# EasyEDA Pro project XDS110_高速隔离版.epro

# Schematic Schematic1
Board Name: Board1; Create Date: 2024-12-06; Page Name: P1; Project Name: XDS110_TI; Schematic Name: Schematic1; Update Date: 2025-01-04; BladeWidth: 10; Company: 嘉立创EDA; Page Size: C; RegionStart: 1; ShowBorder: 1; TitleBlock: 1; TitleBlockPosition: 3; Version: V1.0; XRegionCount: 6; YRegionCount: 4
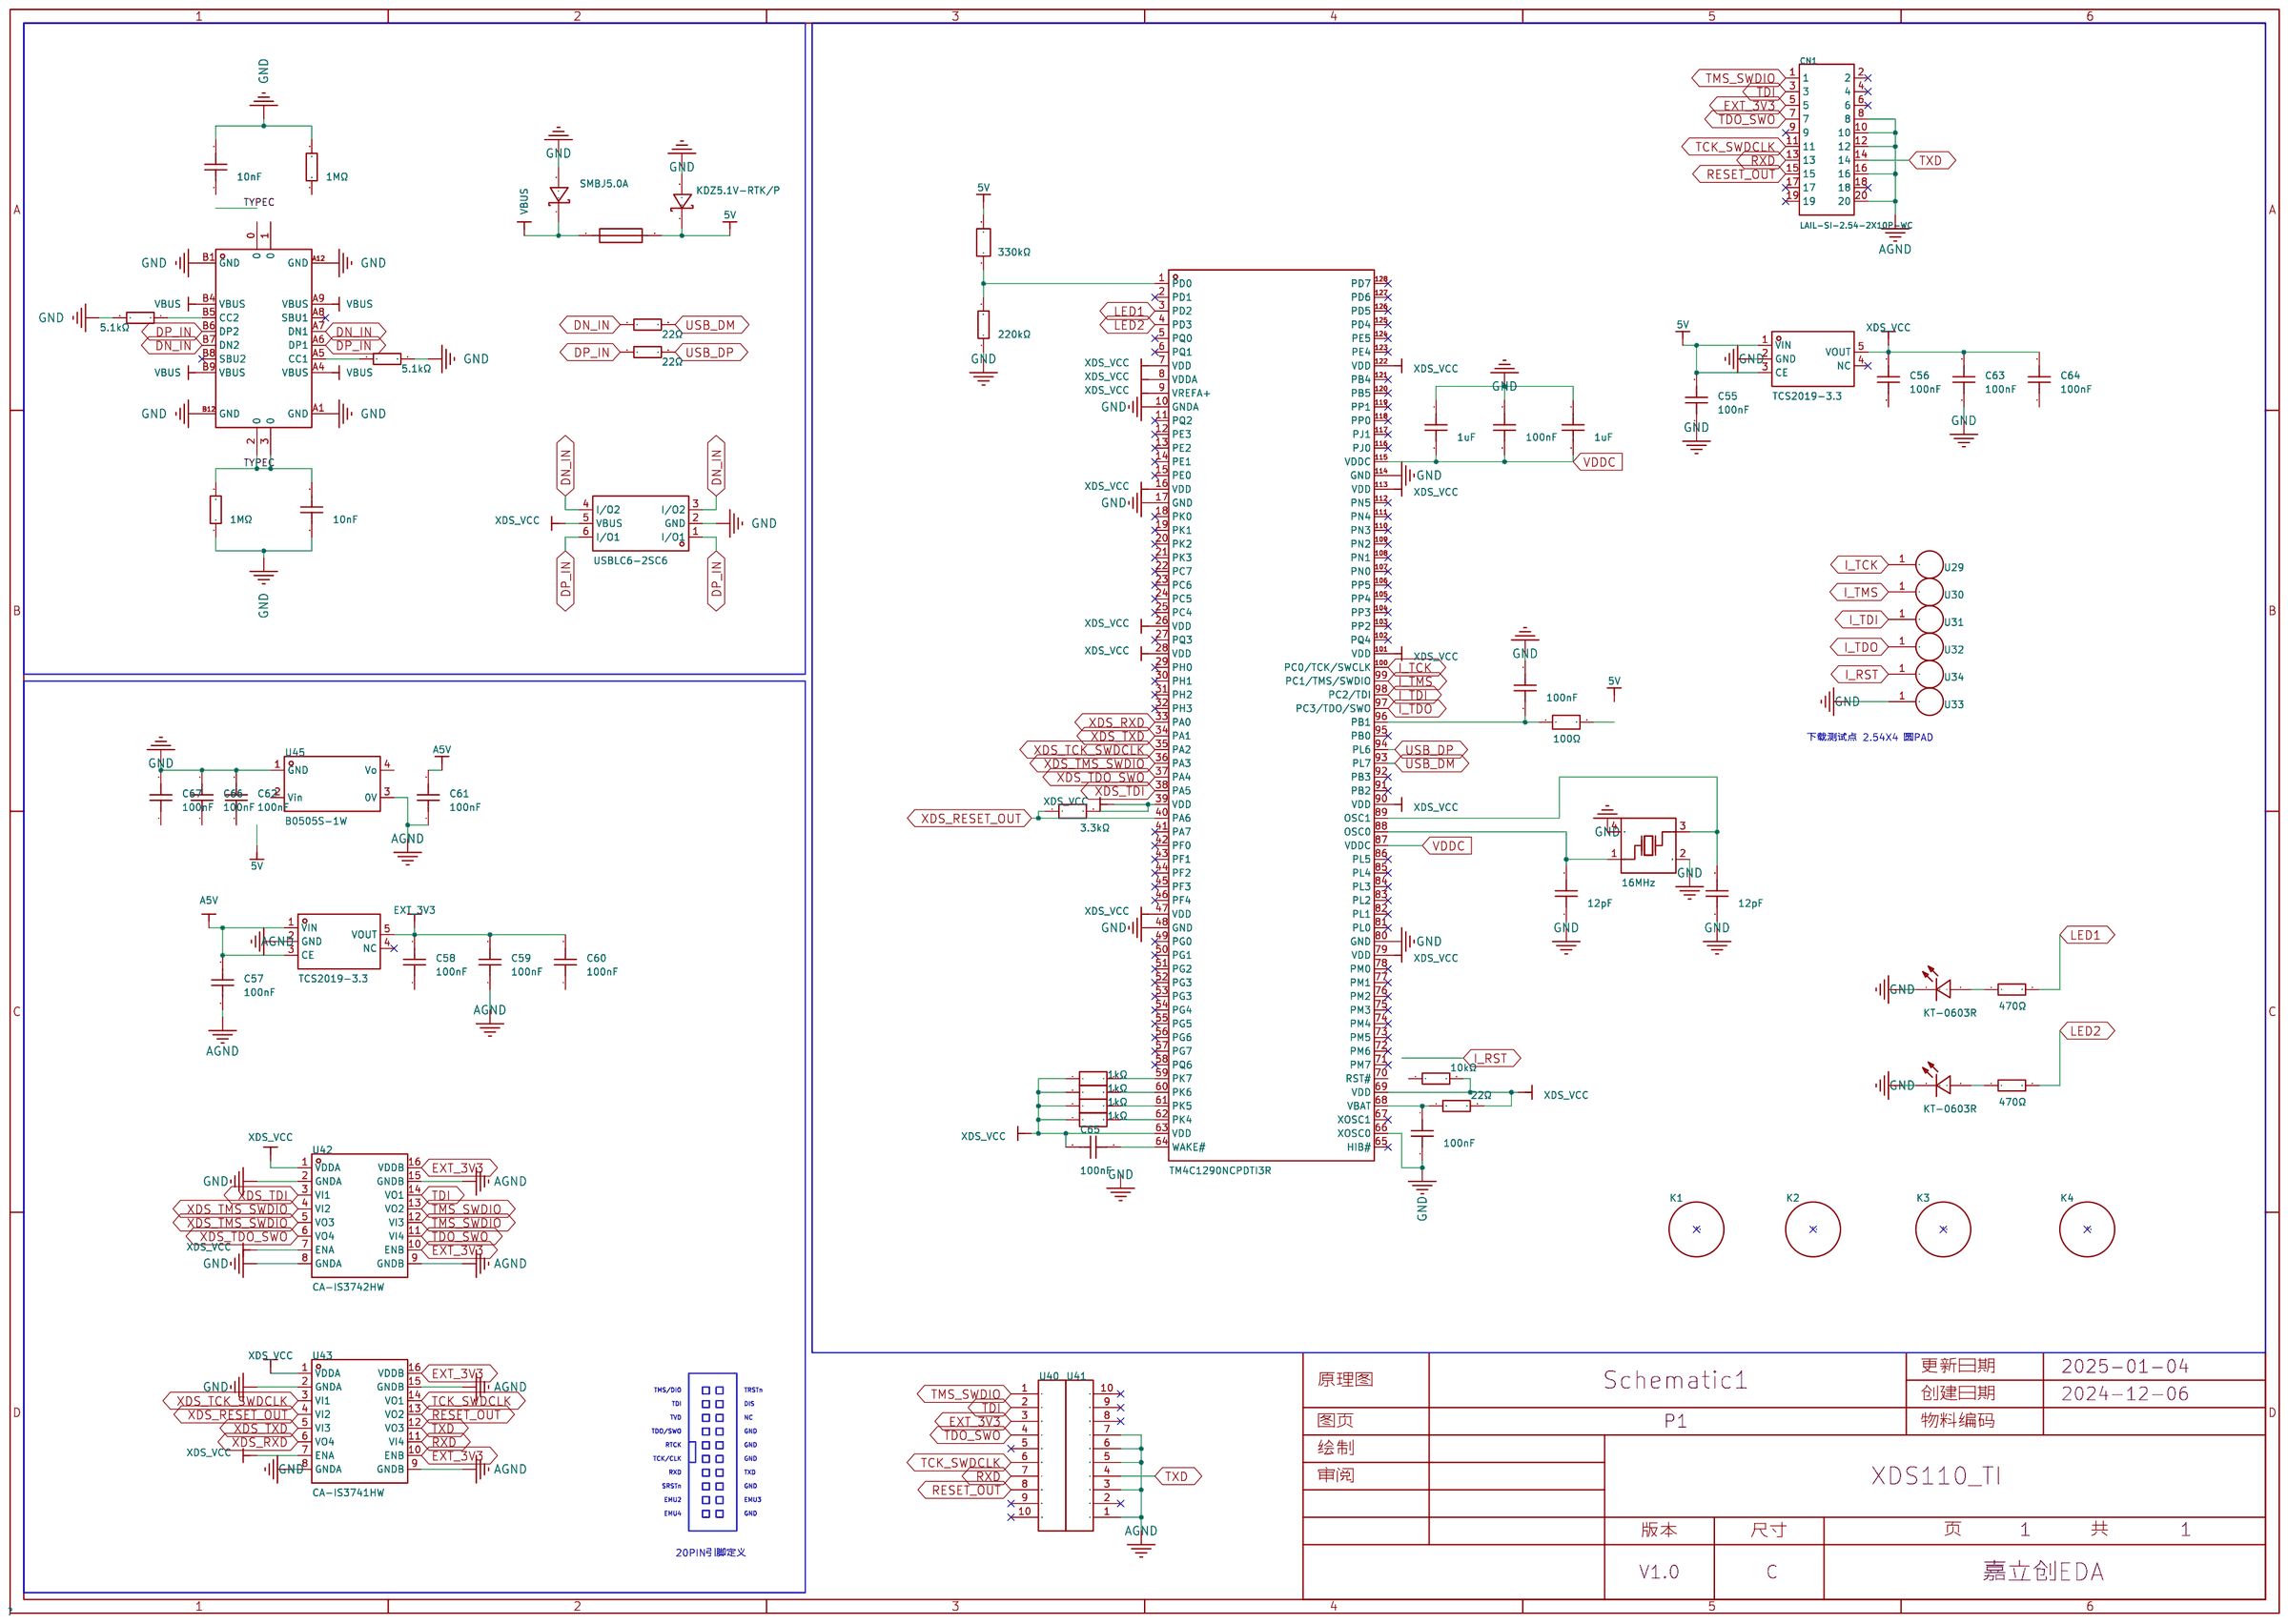
[diagram p0: schematic sheet]

## Parts
C44  10nF  [C0603]
C45  10nF  [C0603]
C46  100nF  [C0603]
C49  1uF  [C0603]
C50  100nF  [C0603]
C51  1uF  [C0603]
C52  100nF  [C0603]
C53  12pF  [C0603]
C54  12pF  [C0603]
C55  100nF  [C0603]
C56  100nF  [C0603]
C57  100nF  [C0603]
C58  100nF  [C0603]
C59  100nF  [C0603]
C60  100nF  [C0603]
C61  100nF  [C0603]
C62  100nF  [C0603]
C63  100nF  [C0603]
C64  100nF  [C0603]
C65  100nF  [C0603]
C66  100nF  [C0603]
C67  100nF  [C0603]
CN1  LAIL-SI-2.54-2X10P-WC  [IDC-TH_20P-P2.54-H-R2-C10-S2.54]  (no BOM)
D1  SMBJ5.0A  [SMB_L4.6-W3.6-LS5.3-RD]
D2  KDZ5.1V-RTK/P  [SOD-323_L1.7-W1.3-LS2.5-RD]
D3  USBLC6-2SC6  [SOT-23-6_L2.9-W1.6-P0.95-LS2.8-BL]
F1  JK-nSMD050-30  [F1206]
J1  -  [USB-C_SMD-TYPE-C-31-M-12]
K1  -  [125 X 300]
K2  -  [125 X 300]
K3  -  [125 X 300]
K4  -  [125 X 300]
LED1  KT-0603R  [LED0603-RD]
LED2  KT-0603R  [LED0603-RD]
R4  470Ω  [R0603]
R33  5.1kΩ  [R0603]
R34  5.1kΩ  [R0603]
R40  22Ω  [R0603]
R41  22Ω  [R0603]
R42  1MΩ  [R0603]
R43  1MΩ  [R0603]
R44  1kΩ  [R0603]
R45  1kΩ  [R0603]
R46  1kΩ  [R0603]
R47  1kΩ  [R0603]
R50  100Ω  [R0603]
R51  330kΩ  [R0603]
R52  220kΩ  [R0603]
R54  470Ω  [R0603]
R55  10kΩ  [R0603]
R63  3.3kΩ  [R0603]
R64  22Ω  [R0603]
U2  TM4C1290NCPDTI3R  [TQFP-128_L14.0-W14.0-P0.40-LS16.0-BL]
U22  TCS2019-3.3  [SOT-23-5_L2.9-W1.6-P0.95-LS2.8-BL]
U24  16MHz  [CRYSTAL-SMD_4P-L3.2-W2.5-BL]
U29  -  [TEST_PAD]
U30  -  [TEST_PAD]
U31  -  [TEST_PAD]
U32  -  [TEST_PAD]
U33  -  [TEST_PAD]
U34  -  [TEST_PAD]
U40  -  [2.54X10P-S]
U41  -  [2.54X10P-S]
U42  CA-IS3742HW  [SOIC-16_L10.3-W7.5-P1.27-LS10.3-BL]
U43  CA-IS3741HW  [SOIC-16_L10.3-W7.5-P1.27-LS10.3-BL]
U44  TCS2019-3.3  [SOT-23-5_L2.9-W1.6-P0.95-LS2.8-BL]
U45  B0505S-1W  [PWRM-TH_BXXXXS-1W]

## Library data of the parts
C44 C45 = CC0603KRX7R9BB103: 容值:10nF;精度:±10%;额定电压:50V;材质(温度系数):X7R;; LCSC Part Name: 10nF ±10% 50V; Supplier Part: C100042; Manufacturer: YAGEO(国巨); Supplier Footprint: 0603; JLCPCB Part Class: Extended Part; Datasheet: https://atta.szlcsc.com/upload/public/pdf/source/20181008/C309510_22F155564471FAF6A489F7D68F34234E.pdf; Supplier: LCSC; Tolerance: ±10%; Voltage Rated: 50V; Temperature Coefficient: X7R
C46 C50 C52 C55-C67 = CGA0603X7R104K500JT: 容值:100nF;精度:±10%;额定电压:50V;材质(温度系数):X7R;; LCSC Part Name: 100nF ±10% 50V; Supplier Part: C6119867; Manufacturer: HRE(芯声); Supplier Footprint: 0603; JLCPCB Part Class: Extended Part; Supplier: LCSC; Tolerance: ±10%; Voltage Rated: 50V; Temperature Coefficient: X7R
C49 C51 = CGA0603X5R105K160JT: 容值:1uF;精度:±10%;额定电压:16V;材质(温度系数):X5R;; LCSC Part Name: 1uF ±10% 16V; Supplier Part: C6119849; Manufacturer: HRE(芯声); Supplier Footprint: 0603; JLCPCB Part Class: Extended Part; Supplier: LCSC; Tolerance: ±10%; Voltage Rated: 16V; Temperature Coefficient: X5R
C53 C54 = CL10C120JB81PNC: 容值:12pF;精度:±5%;额定电压:50V;材质(温度系数):C0G;; LCSC Part Name: 12pF ±5% 50V; Supplier Part: C346206; Manufacturer: SAMSUNG(三星); Supplier Footprint: 0603; Datasheet: https://atta.szlcsc.com/upload/public/pdf/source/20200508/C346214_8E91697E89AACDA228C00DCFD6338EB9.pdf; Supplier: LCSC; Tolerance: ±5%; Voltage Rated: 50V; Temperature Coefficient: C0G
CN1 = LAIL-SI-2.54-2X10P-WC: 连接器类型:简牛座;间距:2.54mm;额定电流:3A;安装方式:弯插;行距:2.54mm;排数:2;每排PIN数:10;触头材质:黄铜;触头镀层:金;工作温度:-40℃~+105℃;; LCSC Part Name: 2.54mm 排数:2 每排P数:10; Supplier Part: C55118384; Manufacturer: 莱联; Supplier Footprint: 弯插,P=2.54mm; JLCPCB Part Class: Extended Part; Datasheet: https://item.szlcsc.com/datasheet/LAIL-SI-2.54-2X10P-WC/58822694.html; Supplier: LCSC; Connector Type: 简牛座; Pitch: 2.54mm; Current Rating: 3A; Holder Type: 弯插; Row Spacing: 2.54mm; Number of Rows: 2; Number of PINs Per Row: 10; Contact Material: 黄铜; Contact Plating: 金; Operating Temperature: -40℃~+105℃; Color: 黑色
D1 = SMBJ5.0A: 反向截止电压(Vrwm):5V;最大钳位电压:9.2V;峰值脉冲电流(Ipp)@10/1000us:65.22A;击穿电压:6.4V;; Supplier Part: C357965; Manufacturer: DOWO(东沃); Supplier Footprint: SMB(DO-214AA); Datasheet: https://atta.szlcsc.com/upload/public/pdf/source/20190724/C406700_6369D0A46FA5E14EA5A4BABB7177C57B.pdf; Supplier: LCSC; Reverse Stand-Off Voltage (Vrwm): 5V; Maximum Clamping Voltage: 9.2V; Peak Pulse Current (Ipp)@10/1000us: 65.22A; Breakdown Voltage: 6.4V; Type: TVS
D2 = KDZ5.1V-RTK/P: 二极管配置:独立式;稳压值(标称值):-;稳压值(范围):4.8V~5.4V;功率(Pd):200mW;; LCSC Part Name: KDZ5.1V-RTK/P 停产; Supplier Part: C155471; Manufacturer: KEC; Supplier Footprint: USC(SOD-323); JLCPCB Part Class: 扩展库; Datasheet: https://atta.szlcsc.com/upload/public/pdf/source/20171201/C155472_15121212927631157469.pdf; Supplier: LCSC; Diode Configuration: 独立式; Reverse Leakage Current (Ir): 1uA@1.5V; Zener Voltage (Range): 4.8V~5.4V; Power Dissipation: 200mW; Zener Impedance (Zzt): 70Ω
D3 = USBLC6-2SC6: 最大钳位电压:15V;击穿电压:6V;; Supplier Part: C2687116; Manufacturer: UMW(友台半导体); Supplier Footprint: SOT-23-6; Datasheet: https://atta.szlcsc.com/upload/public/pdf/source/20231109/512642D850D9873E7C519F71E85B9A10.pdf; Supplier: LCSC; Maximum Clamping Voltage: 15V; Breakdown Voltage: 6V; Number of Lines: 双路; Type: ESD
F1 = JK-nSMD050-30: 最大电压:30V;最大电流:100A;保持电流:500mA;跳闸电流:1A;消耗功率:600mW;初始态阻值(最小值):150mΩ;跳断后阻值(最大值):300mΩ;最大动作时间:100ms;工作温度:-40℃~+85℃;; LCSC Part Name: 0.5A 30V 1206 自恢复保险丝 PTC; Supplier Part: C720075; Manufacturer: JK(金科); Supplier Footprint: 1206; JLCPCB Part Class: Extended Part; Datasheet: https://atta.szlcsc.com/upload/public/pdf/source/20200810/C720075_06AF2D4541537091880CC35F0EFB49F8.pdf; Supplier: LCSC; Operating Voltage (Max): 30V; Current Rating (Max): 100A; Hold Current: 500mA; Trip Current: 1A; Power Dissipation: 600mW; Resistance - Initial (Ri) (Min): 150mΩ; Resistance - Post Trip (R1) (Max): 300mΩ; Maximum Time to Trip: 100ms; Operating Temperature: -40℃~+85℃
J1 = TYPE-C-31-M-12: 连接器类型:Type-C;标准:-;公母:母座;触点数量:16;端口数量:1;额定电流 - 电源:250mA;; Supplier Part: C165948; Manufacturer: 韩国韩荣; JLCPCB Part Class: Extended Part; Datasheet: https://atta.szlcsc.com/upload/public/pdf/source/20210111/C2682493_D8CCFED08835E878D16ACCF4460E43B8.pdf; Supplier: LCSC; Connector Type: Type-C; Gender: 母座; Number of Contacts: 16; Number of Ports: 1; Current Rating - Power (Max): 250mA
K1-K4 = 125 X 300: Standardization Check: false
LED1 LED2 = KT-0603R: 发光颜色:红色;功率:-;正向电流:-;主波长:-;二极管配置:-;透镜颜色:-;色温:-;发光角度:-;载带方式:-;工作温度:-40℃~+85℃;; LCSC Part Name: 0603 红灯 高亮; Supplier Part: C2286; Manufacturer: KENTO; Supplier Footprint: 0603; JLCPCB Part Class: 基础库; Datasheet: https://atta.szlcsc.com/upload/public/pdf/source/20160616/1466072038404.pdf; Supplier: LCSC; Emitted Color: 红色; Operating Temperature: -40℃~+85℃
R4 R54 = 0603WAF4700T5E: 电阻类型:厚膜电阻;阻值:470Ω;精度:±1%;功率:100mW;最大工作电压:75V;温度系数:±100ppm/℃;; LCSC Part Name: 470Ω ±1% 100mW 厚膜电阻; Supplier Part: C23179; Manufacturer: UNI-ROYAL(厚声); Supplier Footprint: 0603; JLCPCB Part Class: Basic Part; Datasheet: https://atta.szlcsc.com/upload/public/pdf/source/20200306/C422600_1E6D84923E4A46A82E41ADD87F860B5C.pdf; Supplier: LCSC; Type: 厚膜电阻; Tolerance: ±1%; Power(Watts): 100mW; Overload Voltage (Max): 75V; Temperature Coefficient: ±100ppm/℃; Operating Temperature Range: -55℃~+155℃
R33 R34 = 0603WAF5101T5E: 电阻类型:厚膜电阻;阻值:5.1kΩ;精度:±1%;功率:100mW;最大工作电压:75V;温度系数:±100ppm/℃;; LCSC Part Name: 5.1kΩ ±1% 100mW 厚膜电阻; Supplier Part: C23186; Manufacturer: UNI-ROYAL(厚声); Supplier Footprint: 0603; JLCPCB Part Class: Basic Part; Datasheet: https://atta.szlcsc.com/upload/public/pdf/source/20200306/C422600_1E6D84923E4A46A82E41ADD87F860B5C.pdf; Supplier: LCSC; Type: 厚膜电阻; Tolerance: ±1%; Power(Watts): 100mW; Overload Voltage (Max): 75V; Temperature Coefficient: ±100ppm/℃; Operating Temperature Range: -55℃~+155℃
R40 R41 R64 = 0603WAF220JT5E: 电阻类型:厚膜电阻;阻值:22Ω;精度:±1%;功率:100mW;最大工作电压:75V;温度系数:±100ppm/℃;; LCSC Part Name: 22Ω ±1% 100mW 厚膜电阻; Supplier Part: C23345; Manufacturer: UNI-ROYAL(厚声); Supplier Footprint: 0603; JLCPCB Part Class: Basic Part; Datasheet: https://atta.szlcsc.com/upload/public/pdf/source/20200306/C422600_1E6D84923E4A46A82E41ADD87F860B5C.pdf; Supplier: LCSC; Type: 厚膜电阻; Tolerance: ±1%; Power(Watts): 100mW; Overload Voltage (Max): 75V; Temperature Coefficient: ±100ppm/℃; Operating Temperature Range: -55℃~+155℃
R42 R43 = 0603WAF1004T5E: 电阻类型:厚膜电阻;阻值:1MΩ;精度:±1%;功率:100mW;最大工作电压:75V;温度系数:±100ppm/℃;; LCSC Part Name: 1MΩ ±1% 100mW 厚膜电阻; Supplier Part: C22935; Manufacturer: UNI-ROYAL(厚声); Supplier Footprint: 0603; Datasheet: https://atta.szlcsc.com/upload/public/pdf/source/20200306/C422600_1E6D84923E4A46A82E41ADD87F860B5C.pdf; Supplier: LCSC; Type: 厚膜电阻; Tolerance: ±1%; Power(Watts): 100mW; Overload Voltage (Max): 75V; Temperature Coefficient: ±100ppm/℃; Operating Temperature Range: -55℃~+155℃
R44-R47 = AS03W4J0102T5E: 电阻类型:厚膜电阻;阻值:1kΩ;精度:±5%;功率:250mW;最大工作电压:75V;温度系数:±100ppm/℃;; LCSC Part Name: 1kΩ ±5% 250mW 厚膜电阻; Supplier Part: C966204; Manufacturer: UNI-ROYAL(厚声); Supplier Footprint: 0603; Datasheet: https://atta.szlcsc.com/upload/public/pdf/source/20200723/C560412_34ABBCC623B52ADD707B94178459E29E.pdf; Supplier: LCSC; Type: 厚膜电阻; Tolerance: ±5%; Power(Watts): 250mW; Overload Voltage (Max): 75V; Temperature Coefficient: ±100ppm/℃; Operating Temperature Range: -55℃~+155℃
R50 = AR03BTD1000: 阻值:100Ω;精度:±0.1%;功率:62.5mW;温度系数:±50ppm/℃;; LCSC Part Name: 100Ω ±0.1% 62.5mW; Supplier Part: C881893; Manufacturer: Viking(光颉); Supplier Footprint: 0603; Datasheet: https://atta.szlcsc.com/upload/public/pdf/source/20191129/C465721_10D49275DB41E427863CE9C8D788770A.pdf; Supplier: LCSC; Tolerance: ±0.1%; Power(Watts): 62.5mW; Temperature Coefficient: ±50ppm/℃
R51 = CR0603J330KP05Z: 电阻类型:厚膜电阻;阻值:330kΩ;精度:±5%;功率:100mW;温度系数:±100ppm/℃;; LCSC Part Name: 厚膜电阻 330kΩ ±5% 100mW; Supplier Part: C881174; Manufacturer: EVER OHMS(天二科技); Supplier Footprint: 0603; Datasheet: https://atta.szlcsc.com/upload/public/pdf/source/20201014/C881429_ABC29D63C8D6A11EB63D87348B25AA7B.pdf; Supplier: LCSC; Type: 厚膜电阻; Tolerance: ±5%; Power(Watts): 100mW; Temperature Coefficient: ±100ppm/℃; Operating Temperature Range: -55℃~+155℃
R52 = PTFR0603B220KP9: 电阻类型:薄膜电阻;阻值:220kΩ;精度:±0.1%;功率:100mW;最大工作电压:100V;温度系数:±25ppm/℃;; LCSC Part Name: 薄膜电阻 220kΩ ±0.1% 100mW; Supplier Part: C351667; Manufacturer: RESI(开步睿思); Supplier Footprint: 0603; Datasheet: https://atta.szlcsc.com/upload/public/pdf/source/20240506/11BDC7478D84177AC2A5326A65B6EB29.pdf; Supplier: LCSC; Type: 薄膜电阻; Tolerance: ±0.1%; Power(Watts): 100mW; Overload Voltage (Max): 100V; Temperature Coefficient: ±25ppm/℃; Operating Temperature Range: -55℃~+125℃
R55 = HV73V1JTTD1002F: 电阻类型:厚膜电阻;阻值:10kΩ;精度:±1%;功率:100mW;温度系数:±100ppm/℃;; LCSC Part Name: 厚膜电阻 10kΩ ±1% 100mW; Supplier Part: C3930526; Manufacturer: KOA; Supplier Footprint: 0603; JLCPCB Part Class: 扩展库; Supplier: LCSC; Type: 厚膜电阻; Tolerance: ±1%; Power(Watts): 100mW; Temperature Coefficient: ±100ppm/℃; Operating Temperature Range: -55℃~+155℃
R63 = MCR03EZPFX3301: 电阻类型:厚膜电阻;阻值:3.3kΩ;精度:±1%;功率:100mW;最大工作电压:50V;温度系数:±100ppm/℃;; LCSC Part Name: 厚膜电阻 3.3kΩ ±1% 100mW; Supplier Part: C161994; Manufacturer: ROHM(罗姆); Supplier Footprint: 0603; Datasheet: https://atta.szlcsc.com/upload/public/pdf/source/20190315/C161994_799CAE167ED844E94A2FAF0782E59E4D.pdf; Supplier: LCSC; Type: 厚膜电阻; Tolerance: ±1%; Power(Watts): 100mW; Overload Voltage (Max): 50V; Temperature Coefficient: ±100ppm/℃; Operating Temperature Range: -55℃~+155℃
U2 = TM4C1290NCPDTI3R: CPU内核:-;程序存储容量:1MB;GPIO端口数量:90;工作电压范围:2.97V~3.63V;CPU最大主频:120MHz;; LCSC Part Name: 具有 120MHZ 频率、1MB 闪存、256KB RAM、USB、基于 Arm Cortex-M4F 的 32 位 MCU; Supplier Part: C470967; Manufacturer: TI(德州仪器); Supplier Footprint: TQFP-128(14x14); JLCPCB Part Class: 扩展库; Datasheet: https://www.ti.com/cn/lit/gpn/tm4c1290ncpdt; Supplier: LCSC; Program Storage Size: 1MB; GPIO Ports Number: 90; Operating Voltage Range: 2.97V~3.63V; CPU Maximum Speed: 120MHz; Operating Temperature Range: -40℃~+85℃; ADC (Bit): 12bit; Universal Serial Bus: 有; Watchdog: 有; Infrared Data Association: 有; Low-Voltage Detect: 有; Direct Memory Access: 有; Internal Oscillator: 有
U22 U44 = TCS2019-3.3: Supplier Part: C9900011639; Supplier Footprint: SOT-23-5; JLCPCB Part Class: 扩展库; Supplier: LCSC
U24 = ECS-160-9-33B-CWN-TR: 频率:16MHz;常温频差:±10ppm;外接负载电容:9pF;频率稳定度(全温):±15ppm;; LCSC Part Name: 16MHz ±10ppm 9pF; Supplier Part: C2599119; Manufacturer: ECS; Supplier Footprint: SMD3225-4P; JLCPCB Part Class: 扩展库; Datasheet: https://atta.szlcsc.com/upload/public/pdf/source/20221101/385B7103C37C13CA6DFA158A3381826D.pdf; Supplier: LCSC; Normal temperature Frequency Tolerance: ±10ppm; External load capacitor: 9pF; Frequency Stability(Full temperature range): ±15ppm; Equivalent Series Resistance (ESR): 60Ω; Operating Temperature: -40℃~+85℃
U29-U34 = TEST_PAD: 测试点PAD; Standardization Check: false
U40 U41 = 2.54X10P-S: Standardization Check: false
U42 = CA-IS3742HW: 4通道数字隔离器,电容隔离; LCSC Part Name: CA-IS374x 高速四通道数字隔离器; Supplier Part: C528654; Manufacturer: Chipanalog(川土微); Supplier Footprint: SOIC-16-300mil; Datasheet: https://atta.szlcsc.com/upload/public/pdf/source/20240402/A6B3DE0FE33F5A1BA9DC823DA65C6095.pdf; Supplier: LCSC; Number of Forward Channels: 2; Number of Reverse Channels: 2; Data Rate(Max): 150Mbps; Isolation Voltage(Vrms): 5000; CMTI(kV/us): 150kV/us; Integrated Power Supply: 否; Operating Temperature: -40℃~125℃; Rating: 工业级
U43 = CA-IS3741HW: 4通道数字隔离器,电容隔离; LCSC Part Name: CA-IS374x 高速四通道数字隔离器; Supplier Part: C428890; Manufacturer: Chipanalog(川土微); Supplier Footprint: SOIC-16-300mil; JLCPCB Part Class: 扩展库; Datasheet: https://atta.szlcsc.com/upload/public/pdf/source/20240402/A6B3DE0FE33F5A1BA9DC823DA65C6095.pdf; Supplier: LCSC; Number of Forward Channels: 3; Number of Reverse Channels: 1; Data Rate(Max): 150Mbps; Isolation Voltage(Vrms): 5000; CMTI(kV/us): 150kV/us; Integrated Power Supply: 否; Operating Temperature: -40℃~125℃; Rating: 工业级
U45 = B0505S-1W: DC-DC 模块电源; Supplier Part: C16787; Manufacturer: MORNSUN(金升阳); Supplier Footprint: SIP-4; Datasheet: https://atta.szlcsc.com/upload/public/pdf/source/20131028/1457706658921.pdf; Supplier: LCSC

## Nets
5V: C55.2 C62.1 C66.1 C67.1 D2.1(C) F1.2 R50.2 R51.2 U22.1(VIN) U22.3(CE) U45.2(Vin)
A5V: C57.2 C61.2 U44.1(VIN) U44.3(CE) U45.4(Vo)
AGND: C57.1 C58.1 C59.1 C60.1 C61.1 CN1.8 CN1.10 CN1.12 CN1.16 CN1.20 U41.1 U41.3 U41.5 U41.6 U41.7 U42.9(GNDB) U42.15(GNDB) U43.9(GNDB) U43.15(GNDB) U44.2(GND) U45.3(0V)
GND: C44.1 C45.2 C46.1 C49.1 C50.1 C51.1 C52.2 C53.1 C54.1 C55.1 C56.1 C62.2 C63.1 C64.1 C65.1 C66.2 C67.2 D1.2(A) D2.2(A) D3.2(GND) J1.A1(GND) J1.A12(GND) J1.B1(GND) J1.B12(GND) LED1.1(K) LED2.1(K) R33.2 R34.2 R42.1 R43.2 R52.1 U2.10(GNDA) U2.17(GND) U2.48(GND) U2.64(WAKE#) U2.66(XOSC0) U2.80(GND) U2.114(GND) U22.2(GND) U24.2(Gnd) U24.4(Gnd) U33.1 U42.2(GNDA) U42.8(GNDA) U43.2(GNDA) U43.8(GNDA) U45.1(GND)
VBUS: D1.1(K) F1.1 J1.A4(VBUS) J1.A9(VBUS) J1.B4(VBUS) J1.B9(VBUS)
VDDC: C49.2 C50.2 C51.2 U2.87(VDDC) U2.115(VDDC)
DN_IN: D3.3(I/O2) D3.4(I/O2) J1.A7(DN1) J1.B7(DN2) R40.1
DP_IN: D3.1(I/O1) D3.6(I/O1) J1.A6(DP1) J1.B6(DP2) R41.1
EXT_3V3: C58.2 C59.2 C60.2 CN1.5 U40.3 U42.10(ENB) U42.16(VDDB) U43.10(ENB) U43.16(VDDB) U44.5(VOUT)
I_RST: R55.1 U2.70(RST#) U34.1
I_TCK: U2.100(PC0/TCK/SWCLK) U29.1
I_TDI: U2.98(PC2/TDI) U31.1
I_TDO: U2.97(PC3/TDO/SWO) U32.1
I_TMS: U2.99(PC1/TMS/SWDIO) U30.1
LED1: R4.2 U2.3(PD2)
LED2: R54.2 U2.4(PD3)
RESET_OUT: CN1.15 U40.8 U43.13(VO2)
RXD: CN1.13 U40.7 U43.11(VI4)
TCK_SWDCLK: CN1.11 U40.6 U43.14(VO1)
TDI: CN1.3 U40.2 U42.14(VO1)
TDO_SWO: CN1.7 U40.4 U42.11(VI4)
TMS_SWDIO: CN1.1 U40.1 U42.12(VI3) U42.13(VO2)
TXD: CN1.14 U41.4 U43.12(VO3)
TYPEC: C44.2 C45.1 J1.0 J1.1(0) J1.2(0) J1.3(0) R42.2 R43.1
USB_DM: R40.2 U2.93(PL7)
USB_DP: R41.2 U2.94(PL6)
XDS_RESET_OUT: R63.1 U2.40(PA6) U43.4(VI2)
XDS_RXD: U2.33(PA0) U43.6(VO4)
XDS_TCK_SWDCLK: U2.35(PA2) U43.3(VI1)
XDS_TDI: U2.38(PA5) U42.3(VI1)
XDS_TDO_SWO: U2.37(PA4) U42.6(VO4)
XDS_TMS_SWDIO: U2.36(PA3) U42.4(VI2) U42.5(VO3)
XDS_TXD: U2.34(PA1) U43.5(VI3)
XDS_VCC: C56.2 C63.2 C64.2 C65.2 D3.5(VBUS) R44.1 R45.1 R46.1 R47.1 R55.2 R63.2 R64.2 U2.7(VDD) U2.8(VDDA) U2.9(VREFA+) U2.16(VDD) U2.26(VDD) U2.28(VDD) U2.39(VDD) U2.47(VDD) U2.63(VDD) U2.69(VDD) U2.79(VDD) U2.90(VDD) U2.101(VDD) U2.113(VDD) U2.122(VDD) U22.5(VOUT) U42.1(VDDA) U42.7(ENA) U43.1(VDDA) U43.7(ENA)
$1N2204: J1.A5(CC1) R34.1
$1N2206: J1.B5(CC2) R33.1
$1N6737: R44.2 U2.62(PK4)
$1N6739: R45.2 U2.61(PK5)
$1N6741: R47.2 U2.59(PK7)
$1N6743: R46.2 U2.60(PK6)
$1N7379: R51.1 R52.2 U2.1(PD0)
$1N7618: LED1.2(A) R4.1
$1N7777: LED2.2(A) R54.1
$1N11125: C46.2 R50.1 U2.96(PB1)
$1N11220: C52.1 R64.1 U2.68(VBAT)
$1N11476: C53.2 U2.88(OSC0) U24.1(In/Out)
$1N11478: C54.2 U2.89(OSC1) U24.3(In/Out)

Not connected (* = marked no-connect by the designer): CN1 2* 4* 6* 9* 17* 18* 19*; J1 A8(SBU1)* B8(SBU2)*; K1 1*; K2 1*; K3 1*; K4 1*; U2 2(PD1)* 5(PQ0)* 6(PQ1)* 11(PQ2)* 12(PE3)* 13(PE2)* 14(PE1)* 15(PE0)* 18(PK0)* 19(PK1)* 20(PK2)* 21(PK3)* 22(PC7)* 23(PC6)* 24(PC5)* 25(PC4)* 27(PQ3)* 29(PH0)* 30(PH1)* 31(PH2)* 32(PH3)* 41(PA7)* 42(PF0)* 43(PF1)* 44(PF2)* 45(PF3)* 46(PF4)* 49(PG0)* 50(PG1)* 51(PG2)* 52(PG3)* 53(PG3)* 54(PG4)* 55(PG5)* 56(PG6)* 57(PG7)* 58(PQ6)* 65(HIB#)* 67(XOSC1)* 71(PM7)* 72(PM6)* 73(PM5)* 74(PM4)* 75(PM3)* 76(PM2)* 77(PM1)* 78(PM0)* 81(PL0)* 82(PL1)* 83(PL2)* 84(PL3)* 85(PL4)* 86(PL5)* 91(PB2)* 92(PB3)* 95(PB0)* 102(PQ4)* 103(PP2)* 104(PP3)* 105(PP4)* 106(PP5)* 107(PN0)* 108(PN1)* 109(PN2)* 110(PN3)* 111(PN4)* 112(PN5)* 116(PJ0)* 117(PJ1)* 118(PP0)* 119(PP1)* 120(PB5)* 121(PB4)* 123(PE4)* 124(PE5)* 125(PD4)* 126(PD5)* 127(PD6)* 128(PD7)*; U22 4(NC)*; U40 5* 9* 10*; U41 2* 8* 9* 10*; U44 4(NC)*

## Notes on the sheet
- 下载测试点 2.54X4 圆PAD
- TDI
- TMS/DIO
- DIS
- TRSTn
- TVD
- NC
- TDO/SWO
- GND
- RTCK
- GND
- TCK/CLK
- GND
- RXD
- SRSTn
- GND
- TXD
- EMU2
- EMU3
- EMU4
- GND
- 20PIN引脚定义

# Board PCB1
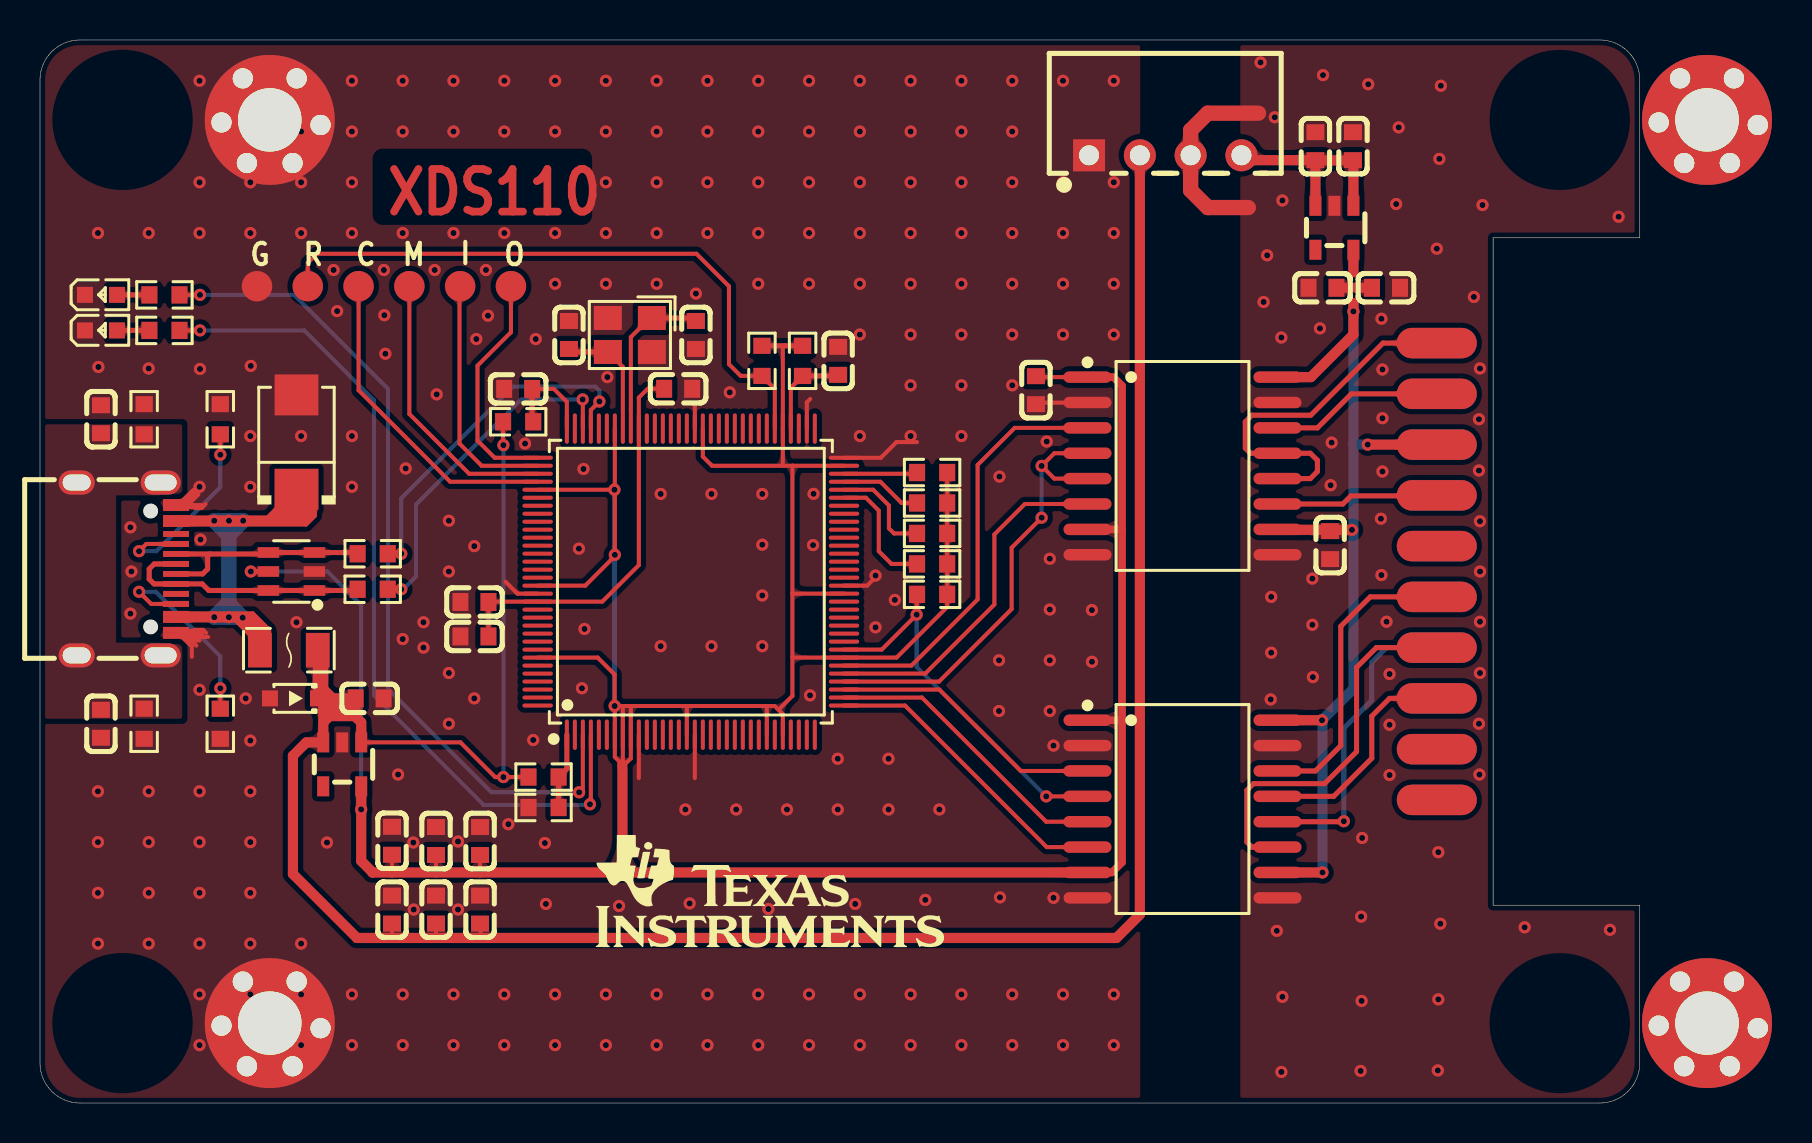
[diagram p1: board, top side]
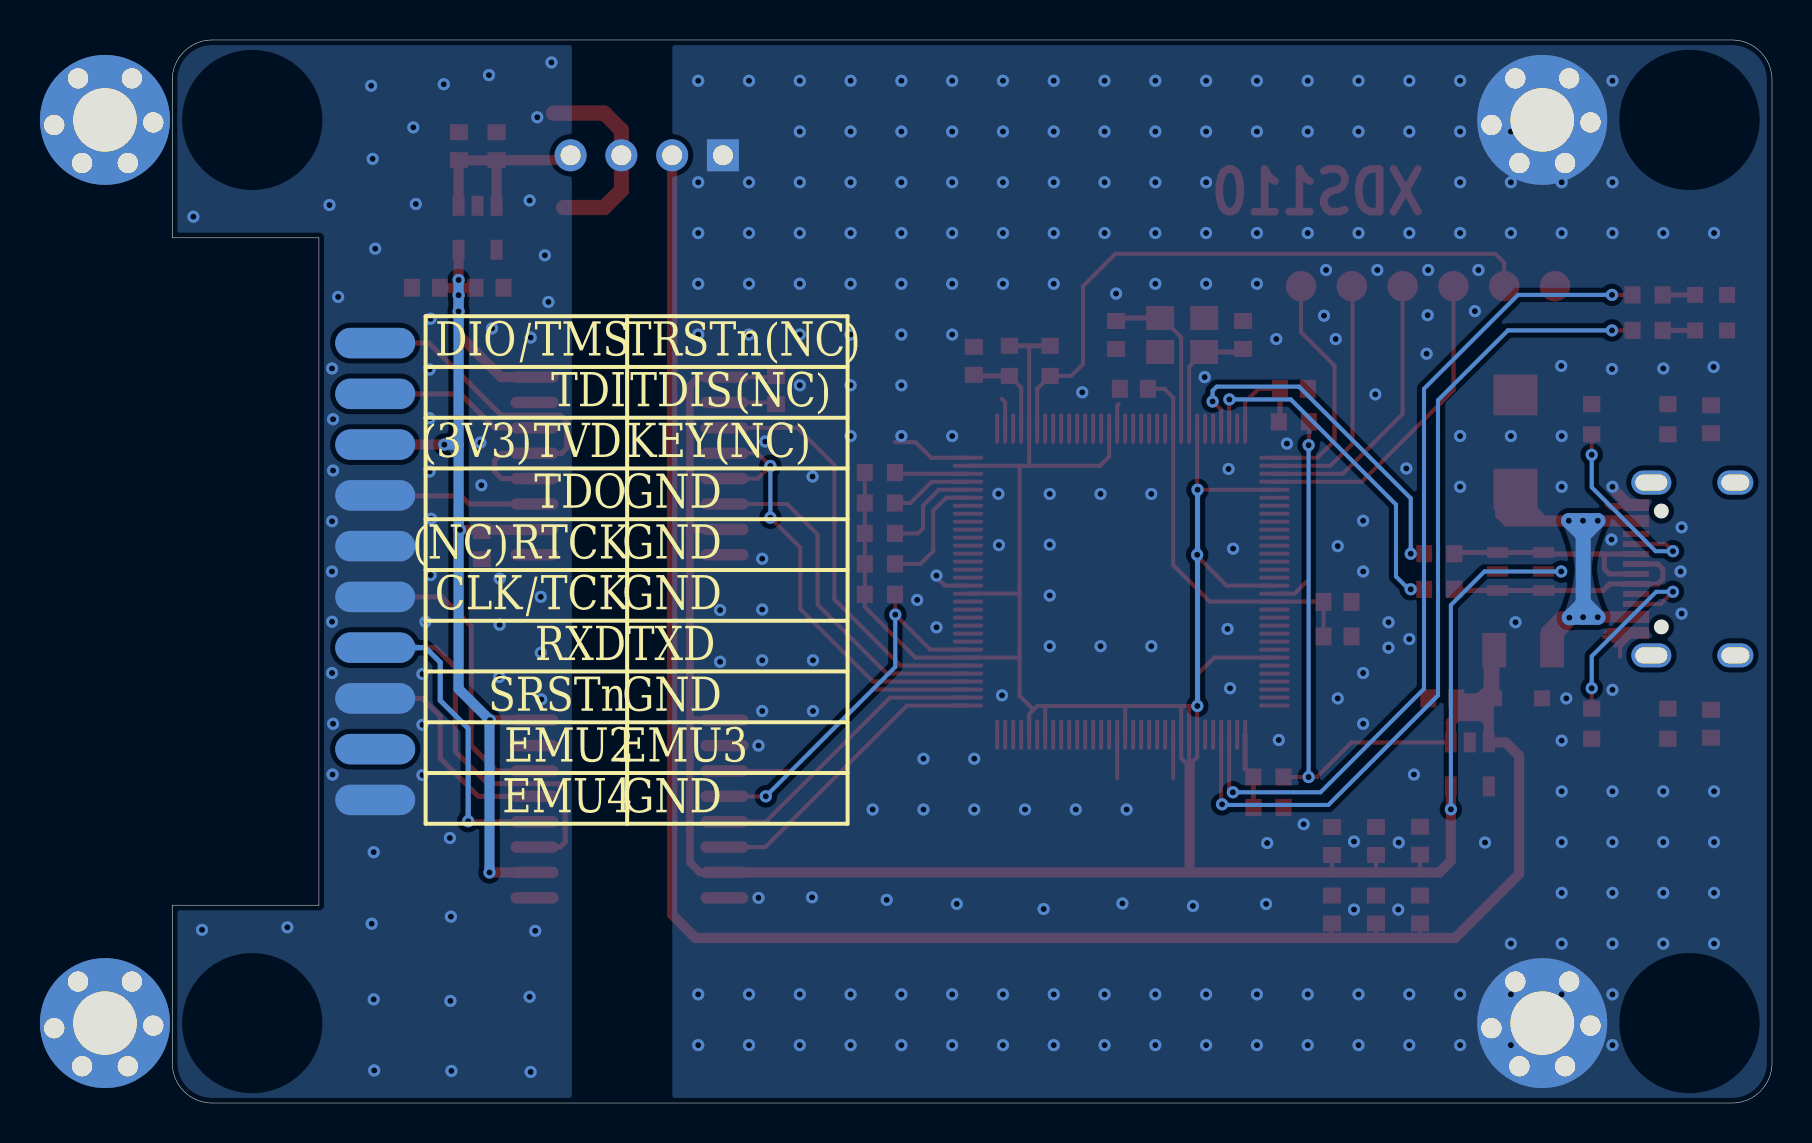
[diagram p2: board, bottom side, seen from below]

Outline 80 x 53.2 mm; copper layers: Top Layer, Bottom Layer. Coordinates in mm from the lower left corner of the outline.
Outline path: 0,51.2 arc(0.59,52.61) 2,53.2 78,53.2 arc(79.41,52.61) 80,51.2 80,43.3 72.67,43.3 72.67,9.9 80,9.9 80,2 arc(79.41,0.59) 78,0 2,0 arc(0.59,0.59) 0,2 0,51.2
Stack: Top Layer 0.035mm / SUBSTRATE1 1.51mm FR4 er 4.5 / Bottom Layer 0.035mm

## Design rules (mm)
spacing copperThickness1oz (default): track to track 0.102, other pairs 0.152 to 0.3
spacing copperThickness2oz: track to track 0.203, other pairs 0.152 to 0.3
spacing Plane_innerPlane: track to track 0.102, other pairs 0.152 to 0.3
spacing Copper_copperRegion: track to track 0.102, other pairs 0.152 to 0.3
track width copperThickness1oz (default): min 0.127, default 0.203, max 2.54
track width copperThickness2oz: min 0.203, default 0.254, max 2.54
differential pair differentialPair (default): width min 0.127, default 0.254, max 2.54; gap min 0.152, default 0.152
pour e837 uses Copper_copperRegion
pour e839 uses Copper_copperRegion
pour e841 uses Copper_copperRegion
pour e843 uses Copper_copperRegion
pour e855 uses Copper_copperRegion
pour e858 uses Copper_copperRegion
pour e860 uses Copper_copperRegion

## Placement (name value [footprint] x y rotation side)
C44  10nF  [C0603]  3.05 18.98 90 top
C45  10nF  [C0603]  3.05 34.22 90 top
C46  100nF  [C0603]  23.91 35.74 0 top
C49  1uF  [C0603]  31.91 35.74 180 top
C50  100nF  [C0603]  21.73 25.08 0 top
C51  1uF  [C0603]  21.73 23.35 0 top
C52  100nF  [C0603]  39.91 37.14 90 top
C53  12pF  [C0603]  32.8 38.44 90 top
C54  12pF  [C0603]  26.45 38.44 270 top
C55  100nF  [C0603]  16.48 20.25 180 top
C56  100nF  [C0603]  19.8 13.11 270 top
C57  100nF  [C0603]  65.66 47.88 270 top
C58  100nF  [C0603]  64.14 40.8 0 top
C59  100nF  [C0603]  67.31 40.8 180 top
C60  100nF  [C0603]  64.52 27.92 90 top
C61  100nF  [C0603]  63.78 47.88 270 top
C62  100nF  [C0603]  17.6 9.68 90 top
C63  100nF  [C0603]  22.01 13.11 270 top
C64  100nF  [C0603]  17.6 13.12 270 top
C65  100nF  [C0603]  49.8 35.68 90 top
C66  100nF  [C0603]  19.8 9.68 90 top
C67  100nF  [C0603]  22.01 9.68 90 top
D1  SMBJ5.0A  [SMB_L4.6-W3.6-LS5.3-RD]  12.83 33.08 90 top
D2  KDZ5.1V-RTK/P  [SOD-323_L1.7-W1.3-LS2.5-RD]  12.7 20.25 180 top
D3  USBLC6-2SC6  [SOT-23-6_L2.9-W1.6-P0.95-LS2.8-BL]  12.57 26.6 90 top
F1  JK-nSMD050-30  [F1206]  12.45 22.66 0 top
J1  -  [USB-C_SMD-TYPE-C-31-M-12]  4.32 26.73 270 top
K1  -  [125 X 300]  4.13 49.2 0 top
K2  -  [125 X 300]  4.13 4 0 top
K3  -  [125 X 300]  76 49.2 0 top
K4  -  [125 X 300]  76 4 0 top
LED1  KT-0603R  [LED0603-RD]  3.05 40.44 0 top
LED2  KT-0603R  [LED0603-RD]  3.05 38.66 0 top
R4  470Ω  [R0603]  6.22 40.44 0 top
R33  5.1kΩ  [R0603]  9.02 18.98 270 top
R34  5.1kΩ  [R0603]  9.02 34.22 90 top
R40  22Ω  [R0603]  16.64 27.49 0 top
R41  22Ω  [R0603]  16.64 25.71 0 top
R42  1MΩ  [R0603]  5.21 18.98 90 top
R43  1MΩ  [R0603]  5.21 34.22 90 top
R44  1kΩ  [R0603]  44.61 31.55 180 top
R45  1kΩ  [R0603]  44.61 30.03 180 top
R46  1kΩ  [R0603]  44.61 28.5 180 top
R47  1kΩ  [R0603]  44.61 26.98 180 top
R50  100Ω  [R0603]  23.91 34.09 180 top
R51  330kΩ  [R0603]  25.18 16.31 180 top
R52  220kΩ  [R0603]  25.18 14.79 0 top
R54  470Ω  [R0603]  6.22 38.66 0 top
R55  10kΩ  [R0603]  36.1 37.14 90 top
R63  3.3kΩ  [R0603]  44.61 25.46 0 top
R64  22Ω  [R0603]  38.14 37.14 90 top
U2  TM4C1290NCPDTI3R  [TQFP-128_L14.0-W14.0-P0.40-LS16.0-BL]  32.55 26.09 0 top
U22  TCS2019-3.3  [SOT-23-5_L2.9-W1.6-P0.95-LS2.8-BL]  15.11 16.95 180 top
U24  16MHz  [CRYSTAL-SMD_4P-L3.2-W2.5-BL]  29.5 38.44 180 top
U29  -  [TEST_PAD]  15.93 40.88 90 top
U30  -  [TEST_PAD]  18.47 40.88 90 top
U31  -  [TEST_PAD]  21.01 40.88 90 top
U32  -  [TEST_PAD]  23.55 40.88 90 top
U33  -  [TEST_PAD]  10.85 40.88 0 top
U34  -  [TEST_PAD]  13.39 40.88 270 top
U40  -  [2.54X10P-S]  69.85 38.03 0 top
U41  -  [2.54X10P-S]  69.85 15.17 0 bottom
U42  CA-IS3742HW  [SOIC-16_L10.3-W7.5-P1.27-LS10.3-BL]  57.13 31.88 270 top
U43  CA-IS3741HW  [SOIC-16_L10.3-W7.5-P1.27-LS10.3-BL]  57.13 14.71 270 top
U44  TCS2019-3.3  [SOT-23-5_L2.9-W1.6-P0.95-LS2.8-BL]  64.73 43.8 180 top
U45  B0505S-1W  [PWRM-TH_BXXXXS-1W]  56.27 47.43 0 top

## Footprints (pads in the part's own frame, mm; a bottom-side part is the same pattern mirrored in y, then rotated)
2.54X10P-S
  oval 4x1.524 smd: 1(0,0) 2(0,-2.54) 3(0,-5.08) 4(0,-7.62) 5(0,-10.16) 6(0,-12.7) 7(0,-15.24) 8(0,-17.78) 9(0,-20.32) 10(0,-22.86)
125 X 300
  round 1.016 hole 1.021x1.016: 1(4.95,-0.127) 1(6.017,2.078) 1(6.22,-2.159) 1(8.506,-2.159) 1(8.71,2.078) 1(9.903,-0.254)
  round 6.5 hole 3.18x3.175: 1(7.363,0)
C0603
  rect 0.8x0.9 smd: 1(-0.7,0) 2(0.7,0)
CRYSTAL-SMD_4P-L3.2-W2.5-BL
  rect 1.4x1.2 smd: 1(-1.1,-0.85) 2(1.1,-0.85) 3(1.1,0.85) 4(-1.1,0.85)
F1206
  rect 1.192x1.727 smd: 1(-1.446,0) 2(1.446,0)
LED0603-RD
  rect 0.8x0.8 smd: 1(-0.799,0) 2(0.799,0)
PWRM-TH_BXXXXS-1W
  rect 1.6x1.6 hole 1: 1(-3.81,0)
  round 1.6 hole 1: 2(-1.27,0) 3(1.27,0) 4(3.81,0)
R0603
  rect 0.806x0.864 smd: 1(-0.753,0) 2(0.753,0)
SMB_L4.6-W3.6-LS5.3-RD
  rect 2.047x2.192 smd: 1(-2.361,0) 2(2.361,0)
SOD-323_L1.7-W1.3-LS2.5-RD
  rect 0.8x0.8 smd: 1(-1.2,0) 2(1.2,0)
SOIC-16_L10.3-W7.5-P1.27-LS10.3-BL
  oval 0.574x2.401 smd: 1(-4.445,-4.75) 2(-3.175,-4.75) 3(-1.905,-4.75) 4(-0.635,-4.75) 5(0.635,-4.75) 6(1.905,-4.75) 7(3.175,-4.75) 8(4.445,-4.75) 9(4.445,4.75) 10(3.175,4.75) 11(1.905,4.75) 12(0.635,4.75) 13(-0.635,4.75) 14(-1.905,4.75) 15(-3.175,4.75) 16(-4.445,4.75)
SOT-23-5_L2.9-W1.6-P0.95-LS2.8-BL
  rect 0.6x1 smd: 1(-0.95,-1.1) 2(0,-1.1) 3(0.95,-1.1) 4(0.95,1.1) 5(-0.95,1.1)
SOT-23-6_L2.9-W1.6-P0.95-LS2.8-BL
  rect 0.532x1.072 smd: 1(-0.95,-1.149) 2(0,-1.149) 3(0.95,-1.149) 4(0.95,1.149) 5(0,1.149) 6(-0.95,1.149)
TEST_PAD
  round 1.524 smd: 1(0,0)
TQFP-128_L14.0-W14.0-P0.40-LS16.0-BL
  oval 0.2x1.52 smd: 1(-6.2,-7.66) 2(-5.8,-7.66) 3(-5.4,-7.66) 4(-5,-7.66) 5(-4.6,-7.66) 6(-4.2,-7.66) 7(-3.8,-7.66) 8(-3.4,-7.66) 9(-3,-7.66) 10(-2.6,-7.66) 11(-2.2,-7.66) 12(-1.8,-7.66) 13(-1.4,-7.66) 14(-1,-7.66) 15(-0.6,-7.66) 16(-0.2,-7.66) 17(0.2,-7.66) 18(0.6,-7.66) 19(1,-7.66) 20(1.4,-7.66) 21(1.8,-7.66) 22(2.2,-7.66) 23(2.6,-7.66) 24(3,-7.66) 25(3.4,-7.66) 26(3.8,-7.66) 27(4.2,-7.66) 28(4.6,-7.66) 29(5,-7.66) 30(5.4,-7.66) 31(5.8,-7.66) 32(6.2,-7.66) 65(6.2,7.66) 66(5.8,7.66) 67(5.4,7.66) 68(5,7.66) 69(4.6,7.66) 70(4.2,7.66) 71(3.8,7.66) 72(3.4,7.66) 73(3,7.66) 74(2.6,7.66) 75(2.2,7.66) 76(1.8,7.66) 77(1.4,7.66) 78(1,7.66) 79(0.6,7.66) 80(0.2,7.66) 81(-0.2,7.66) 82(-0.6,7.66) 83(-1,7.66) 84(-1.4,7.66) 85(-1.8,7.66) 86(-2.2,7.66) 87(-2.6,7.66) 88(-3,7.66) 89(-3.4,7.66) 90(-3.8,7.66) 91(-4.2,7.66) 92(-4.6,7.66) 93(-5,7.66) 94(-5.4,7.66) 95(-5.8,7.66) 96(-6.2,7.66)
  oval 1.52x0.2 smd: 33(7.66,-6.2) 34(7.66,-5.8) 35(7.66,-5.4) 36(7.66,-5) 37(7.66,-4.6) 38(7.66,-4.2) 39(7.66,-3.8) 40(7.66,-3.4) 41(7.66,-3) 42(7.66,-2.6) 43(7.66,-2.2) 44(7.66,-1.8) 45(7.66,-1.4) 46(7.66,-1) 47(7.66,-0.6) 48(7.66,-0.2) 49(7.66,0.2) 50(7.66,0.6) 51(7.66,1) 52(7.66,1.4) 53(7.66,1.8) 54(7.66,2.2) 55(7.66,2.6) 56(7.66,3) 57(7.66,3.4) 58(7.66,3.8) 59(7.66,4.2) 60(7.66,4.6) 61(7.66,5) 62(7.66,5.4) 63(7.66,5.8) 64(7.66,6.2) 97(-7.66,6.2) 98(-7.66,5.8) 99(-7.66,5.4) 100(-7.66,5) 101(-7.66,4.6) 102(-7.66,4.2) 103(-7.66,3.8) 104(-7.66,3.4) 105(-7.66,3) 106(-7.66,2.6) 107(-7.66,2.2) 108(-7.66,1.8) 109(-7.66,1.4) 110(-7.66,1) 111(-7.66,0.6) 112(-7.66,0.2) 113(-7.66,-0.2) 114(-7.66,-0.6) 115(-7.66,-1) 116(-7.66,-1.4) 117(-7.66,-1.8) 118(-7.66,-2.2) 119(-7.66,-2.6) 120(-7.66,-3) 121(-7.66,-3.4) 122(-7.66,-3.8) 123(-7.66,-4.2) 124(-7.66,-4.6) 125(-7.66,-5) 126(-7.66,-5.4) 127(-7.66,-5.8) 128(-7.66,-6.2)
USB-C_SMD-TYPE-C-31-M-12
  oval 1.2x2 hole 0.8x1.6: 0(-4.325,1.716) 0(4.325,1.716)
  oval 1.2x1.8 hole 0.8x1.4: 0(-4.325,-2.484) 0(4.325,-2.484)
  rect 0.3x1.3 smd: A1(-3.35,2.484) A4(-2.55,2.484) A5(-1.25,2.484) A6(-0.25,2.484) A7(0.25,2.484) A8(1.25,2.484) A9(2.55,2.484) A12(3.35,2.484) B1(3.05,2.484) B4(2.25,2.484) B5(1.75,2.484) B6(0.75,2.484) B7(-0.75,2.484) B8(-1.75,2.484) B9(-2.25,2.484) B12(-3.05,2.484)

## Nets
As in the schematic, except:
TYPEC: C44.2 C45.1 J1.0 R42.2 R43.1

Pads without a net: J1 A8 B8; K1 1; K2 1; K3 1; K4 1; U2 2 5 6 11 12 13 14 15 18 19 20 21 22 23 24 25 27 29 30 31 32 41 42 43 44 45 46 49 50 51 52 53 54 55 56 57 58 65 67 71 72 73 74 75 76 77 78 81 82 83 84 85 86 91 92 95 102 103 104 105 106 107 108 109 110 111 112 116 117 118 119 120 121 123 124 125 126 127 128; U22 4; U40 5 9 10; U41 2 8 9 10; U44 4

## Via types
v1: diameter 0.61, hole 0.305, Top Layer to Bottom Layer, 340 vias

## Routing (per net, layer and track width the routed paths; a pad name or vN(x,y) marks a point on that pad's centre or on a via; arc(x,y) is an arc through that point)
5V: length 135.8
  Top Layer w0.203: R51.2 v1(23.17,16.31) 22.76,16.31 21.02,18.05 U22.1 ; 19.8,8.21 C66.1 ; v1(23.17,32.92) 23.16,32.94 R50.2 ; C67.1 22.04,8.95 22.04,8.26 ; C62.1 17.6,8.15
  Top Layer w0.508: 14.16,20.25 D2.1 13.89,20.26 F1.2 14.16,22.39 14.16,20.72 ; 14.16,20.25 14.63,20.25 ; 14.16,20.25 U22.3 13.32,18.05 12.65,17.38 12.65,11.46 15.85,8.26 53.83,8.26 55,9.43 U45.2 ; 14.16,20.25 14.16,20.72 ; 15.55,19.79 15.34,20 14.4,20 ; 15.78,19.32 15.75,19.36 14.48,19.36 ; 15.78,19.32 C55.2 14.63,20.25 ; 15.78,19.32 16.06,19.05 U22.1 ; 14.63,20.25 14.16,20.72 ; 14.25,19.51 14.45,19.72 15.65,19.72 ; 14.48,19.36 14.22,19.36 ; 14.48,19.36 14.2,19.08
  Bottom Layer w0.203: v1(23.17,32.92) v1(23.17,16.31)
A5V: length 10
  Top Layer w0.508: 63.78,44.9 63.78,46.95 ; 63.78,46.95 63.78,46.96 ; 63.78,46.95 64.01,47.17 65.44,47.17 65.68,46.94 U44.1 ; C61.2 60.32,47.18 U45.4
AGND: length 10
  Top Layer w0.762: 60.43,44.81 58.4,44.81 57.54,45.67 U45.3 57.54,48.68 58.39,49.54 60.93,49.54
  vias: v1(61.04,52.08) v1(61.19,40.09) v1(61.37,42.42) v1(61.57,25.33) v1(61.57,22.54) v1(61.54,20.2) v1(61.75,49.33) v1(61.85,8.62) v1(62.13,45.17) v1(62.08,38.31) v1(62.13,5.31) v1(62.08,1.56) v1(63.63,26.24) v1(63.63,23.93) v1(63.65,21.32) v1(64.01,38.77) v1(64.16,51.44) v1(64.54,30.92) v1(64.59,33.05) v1(66.07,9.33) v1(66.04,1.61) v1(66.12,13.27) v1(66.09,5.11) v1(66.42,50.98) v1(67.06,29.24) v1(67.08,39.25) v1(67.13,36.71) v1(67.13,34.27) v1(67.13,31.6) v1(67.08,26.42) v1(67.34,24.09) v1(67.49,21.47) v1(67.49,18.93) v1(67.49,16.41) v1(67.82,44.99) v1(67.95,48.82) v1(69.85,42.75) v1(69.98,47.25) v1(69.93,12.55) v1(69.93,5.19) v1(69.9,1.63) v1(70.05,50.91) v1(70.03,8.97) v1(71.7,40.34) v1(71.96,34.22) v1(71.96,31.65) v1(71.96,18.98) v1(72.01,36.76) v1(72.01,29.11) v1(72.01,26.6) v1(72.01,24.09) v1(72.01,21.52) v1(71.98,16.44) v1(72.14,44.94) v1(74.24,8.79) v1(78.51,8.67) v1(78.94,44.35)
GND: length 30.9
  Top Layer w0.203: U2.66 38.35,35.07 38.52,35.24 ; 29.95,16.26 U2.10 ; U2.64 42.05,32.29 42.83,33.08 43.86,33.08 ; 7.06,30.08 7.31,30.08 ; 7.06,30.08 7.68,30.69 ; 7.06,30.08 J1.A1 ; 7.31,30.08 7.85,30.61 ; 7.31,30.08 7.54,30.08 7.92,30.46 ; 7,23.48 8.1,23.48 ; 7,23.48 7.1,23.38 ; 7,23.48 J1.B1 7.23,23.68 7.29,23.62 7.71,23.62 7.76,23.68 8.16,23.68 8.31,23.53 ; 41.69,26.22 41.36,25.89 U2.48 ; 7.1,23.38 7.16,23.32 ; 7.1,23.38 7.34,23.38 7.39,23.32 ; 7.1,23.38 7.06,23.38 ; U2.80 32.75,34.91 32.67,34.98 ; J1.A12 7.06,23.38 ; 7.06,23.38 7.59,22.84 7.59,22.33 ; 8.28,29.98 8.08,29.78 7.76,29.78 7.71,29.83 7.29,29.83 7.23,29.78 J1.B12 6.95,29.93 8.08,29.93 ; 7.16,23.32 7.33,23.15 7.57,23.15 ; 7.16,23.32 7.39,23.32 ; 7.39,23.32 7.57,23.15 ; 7.39,23.32 8.41,23.32 ; 7.57,23.15 7.98,23.15 ; 7.57,23.15 7.82,22.89 ; U2.17 32.75,16.26 ; 49.8,35.05 52.38,35.05 U42.2 ; U2.114 23.88,25.49 23.28,26.09
  vias: v1(2.9,43.54) v1(2.92,36.84) v1(2.9,15.6) v1(2.9,13.06) v1(2.9,10.52) v1(2.9,7.98) v1(4.52,28.81) v1(4.57,26.6) v1(4.52,24.49) v1(5.44,43.54) v1(5.44,36.76) v1(5.44,15.6) v1(5.44,13.06) v1(5.44,10.52) v1(5.44,7.98) v1(7.98,51.16) v1(7.98,46.08) v1(7.98,43.54) v1(8,36.73) v1(7.98,30.84) v1(8.03,28.2) v1(7.98,20.68) v1(7.98,15.6) v1(7.98,13.06) v1(7.98,10.52) v1(7.98,7.98) v1(7.98,5.44) v1(7.98,2.9) v1(10.29,20.25) v1(10.52,51.16) v1(10.52,48.62) v1(10.52,46.08) v1(10.52,43.54) v1(10.54,36.89) v1(10.52,33.38) v1(10.52,30.84) v1(10.52,18.14) v1(10.52,15.6) v1(10.52,13.06) v1(10.52,10.52) v1(10.52,7.98) v1(10.52,5.44) v1(10.52,2.9) v1(12.83,24.06) v1(13.06,51.16) v1(13.06,48.62) v1(13.06,46.08) v1(13.06,43.54) v1(13.06,33.38) v1(13.06,7.98) v1(13.06,5.44) v1(13.06,2.9) v1(14.35,13.04) v1(14.68,41.69) v1(14.86,39.63) v1(15.6,51.16) v1(15.6,48.62) v1(15.6,46.08) v1(15.6,43.54) v1(15.6,33.38) v1(15.6,30.84) v1(15.6,5.44) v1(15.6,2.9) v1(17.2,41.69) v1(17.22,39.43) v1(17.27,37.5) v1(17.91,16.44) v1(18.14,51.16) v1(18.14,48.62) v1(18.14,43.54) v1(18.14,23.22) v1(18.14,5.44) v1(18.14,2.9) v1(18.29,31.76) v1(18.67,13.04) v1(18.69,9.68) v1(19.18,24.06) v1(19.18,22.79) v1(19.74,41.69) v1(19.84,35.46) v1(20.45,29.14) v1(20.45,26.6) v1(20.45,21.52) v1(20.45,18.98) v1(20.68,51.16) v1(20.68,48.62) v1(20.68,43.54) v1(20.68,5.44) v1(20.68,2.9) v1(20.9,13.09) v1(20.9,9.68) v1(21.72,27.87) v1(21.72,20.25) v1(21.82,38.23) v1(22.3,41.69) v1(22.4,39.4) v1(23.22,51.16) v1(23.22,48.62) v1(23.22,43.54) v1(23.22,5.44) v1(23.22,2.9) v1(23.42,13.95) v1(24.26,33) v1(24.66,18.17) v1(24.79,38.23) v1(25.25,13.01) v1(25.3,9.96) v1(25.76,51.16) v1(25.76,48.62) v1(25.76,43.54) v1(25.76,41) v1(25.76,5.44) v1(25.76,2.9) v1(26.95,27.74) v1(27.1,20.76) v1(27.18,31.73) v1(27.23,23.72) v1(28.3,51.16) v1(28.3,48.62) v1(28.3,46.08) v1(28.3,43.54) v1(28.3,41) v1(28.37,36.33) v1(28.3,5.44) v1(28.3,2.9) v1(28.96,9.86) v1(30.84,51.16) v1(30.84,48.62) v1(30.84,46.08) v1(30.84,43.54) v1(30.84,41) v1(30.84,5.44) v1(30.84,2.9) v1(31.04,30.48) v1(31.04,22.86) v1(32.27,14.69) v1(32.49,9.99) v1(32.8,40.51) v1(33.38,51.16) v1(33.38,48.62) v1(33.38,46.08) v1(33.38,43.54) v1(33.38,5.44) v1(33.38,2.9) v1(33.58,30.48) v1(33.58,22.86) v1(34.49,35.57) v1(34.81,14.69) v1(35.92,51.16) v1(35.92,48.62) v1(35.92,46.08) v1(35.92,43.54) v1(35.92,41) v1(35.92,5.44) v1(35.92,2.9) v1(36.12,30.48) v1(36.12,27.94) v1(36.12,25.4) v1(36.12,22.86) v1(36.42,9.71) v1(37.35,14.69) v1(38.46,51.16) v1(38.46,48.62) v1(38.46,46.08) v1(38.46,43.54) v1(38.46,41) v1(38.46,5.44) v1(38.46,2.9) v1(38.51,20.4) v1(38.66,27.92) v1(38.68,30.49) v1(39.89,17.23) v1(39.89,14.69) v1(40.77,9.96) v1(41,51.16) v1(41,48.62) v1(41,46.08) v1(41,43.54) v1(41,41) v1(41,38.46) v1(41,33.38) v1(41,5.44) v1(41,2.9) v1(41.78,26.4) v1(41.78,23.81) v1(42.43,17.23) v1(42.43,14.69) v1(42.75,25.18) v1(43.54,51.16) v1(43.54,48.62) v1(43.54,46.08) v1(43.54,43.54) v1(43.54,41) v1(43.54,38.46) v1(43.54,35.92) v1(43.54,33.38) v1(43.54,5.44) v1(43.54,2.9) v1(44.27,10.17) v1(44.97,14.69) v1(46.08,51.16) v1(46.08,48.62) v1(46.08,46.08) v1(46.08,43.54) v1(46.08,41) v1(46.08,38.46) v1(46.08,35.92) v1(46.08,33.38) v1(46.08,5.44) v1(46.08,2.9) v1(47.96,22.16) v1(47.96,19.62) v1(47.98,31.35) v1(48.01,10.29) v1(48.62,51.16) v1(48.62,48.62) v1(48.62,46.08) v1(48.62,43.54) v1(48.62,41) v1(48.62,38.46) v1(48.62,35.92) v1(48.62,5.44) v1(48.62,2.9) v1(50.34,33.1) v1(50.5,27.24) v1(50.5,24.7) v1(50.5,22.16) v1(50.5,19.62) v1(50.68,17.89) v1(50.68,10.27) v1(51.16,51.16) v1(51.16,46.08) v1(51.16,43.54) v1(51.16,41) v1(51.16,38.46) v1(51.16,5.44) v1(51.16,2.9) v1(52.6,24.67) v1(52.61,22.08) v1(53.7,51.16) v1(53.7,46.08) v1(53.7,43.54) v1(53.7,41) v1(53.7,38.46) v1(53.7,5.44) v1(53.7,2.9)
VBUS: length 53.7
  Top Layer w0.254: 7.7,29.14 7.56,29.28 ; 7.7,29.14 v1(8.71,29.14) v1(9.45,29.14) v1(10.16,29.14) 13.33,29.14 ; 7.7,29.14 6.96,29.14 J1.B9 13.3,28.98 13.72,29.39 13.72,29.83 D1.1 11.39,29.28 7.56,29.28 ; 7.56,29.28 J1.A4 ; 11.05,22.71 11.43,23.09 11.43,23.68 10.63,24.48 J1.B4 6.96,24.31 7.7,24.31 ; 7.56,24.18 9.79,24.18 11,22.97 ; 7.56,24.18 J1.A9 ; 7.56,24.18 7.7,24.31 ; 7.7,24.31 v1(8.71,24.31) v1(9.44,24.31) 10.03,24.31
  Top Layer w0.508: F1.1 11.05,22.71 11.05,23.81 10.54,24.31 10.16,24.31 ; 10.03,24.31 10.92,23.42 10.92,23.04
  Top Layer w0.762: 13.46,29.52 12.06,29.52 11.81,29.27
  Bottom Layer w0.762: 9.44,28.41 9.44,28.42 ; 9.44,28.41 9.44,25.04 ; 9.44,28.41 v1(8.71,29.14) v1(9.45,29.14) ; 9.44,28.42 9.44,29.13 v1(9.45,29.14) ; 9.44,28.42 v1(10.16,29.14) v1(9.45,29.14) ; v1(9.44,24.31) v1(8.71,24.31) 9.44,25.04 ; v1(9.44,24.31) 10.11,24.31 ; v1(9.44,24.31) 9.44,25.04 ; 10.11,24.31 9.52,24.9 ; 10.11,24.31 v1(10.13,24.29)
VDDC: length 19.8
  Top Layer w0.203: C50.2 C51.2 ; C49.2 30.39,35.74 29.95,35.3 U2.87 29.95,26.92 28.12,25.09 U2.115 22.53,25.09 22.51,25.08 22.45,25.08
DN_IN: length 11.6
  Top Layer w0.254: 8.5,27.48 11.35,27.48 D3.4 ; 8.5,27.48 J1.B7 ; 8.5,27.48 8.38,27.36 8.38,26.73 8.13,26.48 J1.A7 ; 11.49,27.55 D3.3 15.82,27.55 R40.1
DP_IN: length 12.6
  Top Layer w0.254: J1.A6 5.71,26.98 5.46,26.73 5.46,26.22 5.7,25.98 J1.B6 8.12,25.98 8.44,25.65 D3.6 D3.1 15.82,25.65 R41.1
EXT_3V3: length 53.6
  Top Layer w0.508: 65.68,40.8 v1(65.68,41.19) U44.5 ; 65.68,40.8 C58.2 ; 65.68,40.8 v1(65.68,40.43) v1(65.68,39.62) 65.68,38.46 63.55,36.33 61.88,36.33 ; 65.68,40.8 66.69,40.8 ; v1(64.14,11.54) 61.88,11.54 ; 61.88,28.71 61.91,28.68 v1(65.61,28.68) ; v1(66.4,32.95) 69.98,32.95 ; 61.88,19.16 v1(64.11,19.16)
  Bottom Layer w0.508: 65.68,32.94 v1(65.68,39.62) v1(65.68,40.43) v1(65.68,41.19) ; 65.68,32.94 65.69,32.95 v1(66.4,32.95) ; 65.68,32.94 65.68,28.68 ; v1(64.14,11.54) 64.14,19.18 65.68,20.73 65.68,28.68 ; 65.68,28.68 v1(65.61,28.68)
I_RST: length 31.8
  Top Layer w0.203: U34.1 13.39,42.05 13.84,42.5 32.83,42.5 34.45,40.88 34.45,36.98 35.04,36.39 R55.1 36.75,35.74 U2.70
I_TCK: length 16.1
  Top Layer w0.203: U2.100 20.51,31.09 15.93,35.67 U29.1
I_TDI: length 12.3
  Top Layer w0.203: U2.98 22.09,31.89 20.98,33 20.98,40.84 U31.1
I_TDO: length 11.8
  Top Layer w0.203: U2.97 22.74,32.29 21.88,33.15 21.88,36.9 23.55,38.57 U32.1
I_TMS: length 14
  Top Layer w0.203: U30.1 18.47,34.48 21.46,31.49 U2.99
LED1: length 42
  Top Layer w0.203: v1(26.96,15.55) 27.15,15.74 U2.3 ; R4.2 v1(8,40.44)
  Bottom Layer w0.203: v1(8,40.44) 12.7,40.44 17.4,35.74 17.4,20.72 22.58,15.55 v1(26.96,15.55)
LED2: length 42.5
  Top Layer w0.203: R54.2 v1(8,38.66) ; v1(27.5,14.95) 27.55,15 U2.4
  Bottom Layer w0.203: v1(8,38.66) 13.21,38.66 16.7,35.17 16.7,20.4 22.19,14.92 27.47,14.92 v1(27.5,14.95)
RESET_OUT: length 11.2
  Top Layer w0.254: U40.8 67.49,20.25 66.6,19.36 66.6,17.25 64.69,15.35 61.88,15.35
RXD: length 19.2
  Top Layer w0.254: U40.7 66.83,22.79 65.84,21.8 65.84,17.58 64.24,15.98 60.68,15.98 60.35,15.65 60.35,13.06 60.6,12.81 61.88,12.81
TCK_SWDCLK: length 15.1
  Top Layer w0.254: 61.88,16.62 63.78,16.62 65.05,17.89 65.05,23.86 66.52,25.33 U40.6
TDI: length 8.7
  Top Layer w0.254: U40.2 65.58,35.49 63.88,33.79 61.88,33.79
TDO_SWO: length 8.1
  Top Layer w0.254: U40.4 69.82,30.38 65.56,30.38 65.15,29.98 61.88,29.98
TMS_SWDIO: length 19.1
  Top Layer w0.254: U40.1 67.16,38.03 63.55,34.42 60.6,34.42 60.27,34.09 60.27,32.77 60.53,32.52 63.53,32.52 63.88,32.16 63.88,31.6 63.53,31.25 61.88,31.25
TXD: length 15.4
  Top Layer w0.254: v1(65.2,14.1) 65.18,14.08 61.88,14.08
  Bottom Layer w0.254: U41.4 67.34,22.79 66.6,22.05 66.6,20.15 65.2,18.75 v1(65.2,14.1)
USB_DM: length 17.8
  Top Layer w0.203: R40.2 v1(18.07,27.49) ; U2.93 27.55,34.68 v1(27.98,35.11)
  Bottom Layer w0.203: v1(18.07,27.49) 18.07,30.26 23.65,35.85 27.77,35.85 27.98,35.65 v1(27.98,35.11)
USB_DP: length 17.3
  Top Layer w0.203: U2.94 27.15,35.2 v1(27.14,35.21) ; R41.2 v1(18.07,25.71)
  Bottom Layer w0.203: v1(18.07,25.71) 18.16,25.71 18.8,26.35 18.8,29.95 24.06,35.21 v1(27.14,35.21)
XDS_RESET_OUT: length 19.2
  Top Layer w0.203: U2.40 42.09,22.69 v1(43.84,24.44) 43.84,25.44 R63.1 ; U43.4 v1(50.32,15.35)
  Bottom Layer w0.203: v1(43.84,24.44) 43.84,21.82 v1(50.32,15.35)
XDS_RXD: length 15.1
  Top Layer w0.203: U2.33 43.26,19.89 50.34,12.81 U43.6
XDS_TCK_SWDCLK: length 13.9
  Top Layer w0.203: U43.3 49.05,16.62 44.97,20.69 U2.35
XDS_TDI: length 21
  Top Layer w0.203: U42.3 48.74,33.79 46.89,31.93 46.89,25.2 43.58,21.89 U2.38
XDS_TDO_SWO: length 17.7
  Top Layer w0.203: U2.37 44.27,21.49 47.73,24.95 47.73,28.45 49.25,29.98 U42.6
XDS_TMS_SWDIO: length 22.8
  Top Layer w0.203: U42.5 50.72,31.25 v1(50.09,31.88) 50.72,32.52 U42.4 ; U2.36 44.96,21.09 48.59,24.72 48.59,27.79 v1(50.09,29.29)
  Bottom Layer w0.203: v1(50.09,29.29) v1(50.09,31.88)
XDS_TXD: length 14.8
  Top Layer w0.203: U43.5 50.32,14.08 44.1,20.29 U2.34
XDS_VCC: length 199
  Top Layer w0.203: U2.63 37.63,31.89 ; 37.63,31.89 37.63,31.89 37.63,25.49 ; 37.63,31.89 37.16,31.89 ; 49.8,36.45 49.93,36.33 U42.1 ; 29.12,16.82 29.15,16.85 U2.8 29.15,19.84 29.12,19.87 ; 17.51,11.46 17.6,11.56 ; 28.75,30.71 U2.90 ; 28.75,30.71 v1(28.73,30.69) U2.101 ; 28.75,30.71 28.75,27.37 27.27,25.89 U2.113 ; 37.16,31.89 33.6,31.89 33.15,32.35 U2.79 ; 37.16,31.89 37.15,31.91 U2.69 37.15,37.8 37.24,37.89 37.25,37.9 ; R44.1 R45.1 R46.1 R47.1 R63.2 45.36,24.82 42.83,22.29 U2.39 37.65,22.29 37.63,22.31 ; C56.2 19.8,11.5 ; v1(28.74,19.87) 28.74,21.44 27.89,22.29 U2.122 ; 17.6,11.56 17.6,11.52 ; 17.6,11.56 C64.2 ; U2.47 37.63,25.49 37.63,25.49 ; 37.63,25.49 37.63,22.31 ; 29.12,19.87 29.55,19.87 ; 29.12,19.87 28.86,19.87 28.75,19.75 U2.7 28.75,17.32 29.12,16.95 ; 29.55,19.87 U2.9 29.55,17.25 29.24,16.95 ; 29.55,19.87 32.35,19.87 ; 32.35,19.87 36.36,19.87 ; 32.35,19.87 U2.16 ; 36.36,19.87 36.74,19.87 37.15,19.46 U2.28 ; 36.36,19.87 36.35,19.86 U2.26 ; C63.2 22.01,11.55 ; 37.63,22.31 37.63,20.38 36.99,19.74
  Top Layer w0.254: 38.01,37.9 38,37.89 36.36,37.89 ; D3.5 v1(10.54,26.6)
  Top Layer w0.381: U42.1 53.68,36.33 54.11,35.9 54.11,28.71 ; 54.11,19.16 54.11,12.05 53.6,11.54 U43.7 ; 54.11,19.16 54.11,28.71 ; 54.11,19.16 54.11,19.16 U43.1 ; 54.11,28.71 U42.7 ; 22.01,11.55 22.01,11.54
  Top Layer w0.508: 16.64,11.54 U43.7 ; 16.64,11.54 16.61,11.54 ; 16.64,11.54 16.06,12.11 U22.5 ; 29.13,16.7 29.13,11.67 29.05,11.6 ; 29.12,16.82 29.12,16.95
  Bottom Layer w0.203: 10.83,26.6 14.38,26.6 16.06,24.92 v1(16.06,14.7)
  Bottom Layer w0.254: v1(28.74,19.87) 28.73,19.88 v1(28.73,30.69)
  vias: v1(28.75,27.43)
$1N2204: length 10
  Top Layer w0.203: J1.A5 5.31,27.98 v1(4.95,27.62) ; v1(9.02,32.44) R34.1
  Bottom Layer w0.203: v1(9.02,32.44) 9.02,30.82 5.82,27.62 v1(4.95,27.62)
$1N2206: length 10.1
  Top Layer w0.203: J1.B5 5.56,24.98 v1(4.95,25.58) ; v1(9.02,20.76) R33.1
  Bottom Layer w0.203: v1(4.95,25.58) 5.79,25.58 9.02,22.36 v1(9.02,20.76)
$1N6737: length 3.7
  Top Layer w0.203: U2.62 43.8,31.49 R44.2
$1N6739: length 4.1
  Top Layer w0.203: U2.61 42.02,31.09 43.09,30.03 R45.2
$1N6741: length 6.2
  Top Layer w0.203: R47.2 42.58,26.98 41.95,27.62 41.95,29.65 41.3,30.29 U2.59
$1N6743: length 5.2
  Top Layer w0.203: R46.2 42.71,28.5 42.45,28.76 42.45,29.9 41.66,30.69 U2.60
$1N7379: length 3.8
  Top Layer w0.254: R52.2 R51.1 26.35,16.73 U2.1
$1N7618: length 1.6
  Top Layer w0.254: LED1.2 R4.1
$1N7777: length 1.6
  Top Layer w0.254: LED2.2 R54.1
$1N11125: length 5
  Top Layer w0.203: C46.2 25.69,35.74 26.35,35.09 U2.96
  Top Layer w0.254: 24.66,34.09 24.61,34.15 C46.2
$1N11220: length 4.7
  Top Layer w0.203: U2.68 37.55,35.8 R64.1
  Top Layer w0.254: R64.1 39.86,36.39 C52.1
$1N11476: length 7.5
  Top Layer w0.203: 29.55,34.51 29.55,38.33 30.5,39.29 U24.1
  Top Layer w0.254: U24.1 32.65,39.29 C53.2
$1N11478: length 5.4
  Top Layer w0.203: U24.3 29.15,36.84 29.15,34.51
  Top Layer w0.254: U24.3 26.6,37.59 C54.2

## Copper pours and planes (outline as drawn; the poured copper is in the pictures)
AGND on Top Layer: 60.02,53.22 80.01,53.22 80.01,-0.02 60.02,-0.02
AGND on Bottom Layer: 60.02,53.19 80.01,53.19 80.01,-0.07 60.02,-0.07
GND on Top Layer: 0,53.27 55.02,53.27 55.02,-0.07 0,-0.07
GND on Bottom Layer: 0,53.27 54.99,53.27 54.99,-0.07 0,-0.07
TYPEC on Top Layer: 0,31.68 3.81,31.68 3.81,21.77 0,21.77
TYPEC on Top Layer: 0.13,23.04 7.11,23.04 7.11,19.23 0.13,19.23
TYPEC on Top Layer: 0,33.97 7.11,33.97 7.11,30.41 0,30.41

Small or netless copper shapes (teardrops, artwork), in the pictures only: 251 on Top Layer, 39 on Bottom Layer

## Text on the board
Bottom Silkscreen Layer: TRSTn(NC) | TDIS(NC) | KEY(NC) | EMU3 | GND | TXD | TDI | RXD | TDO | EMU2 | EMU4 | SRSTn | DIO/TMS | CLK/TCK | (3V3)TVD | (NC)RTCK
Top Layer: XDS110
Top Solder Mask Layer: aperxman | XDS110
Top Silkscreen Layer: G | R | C | M | I | O
